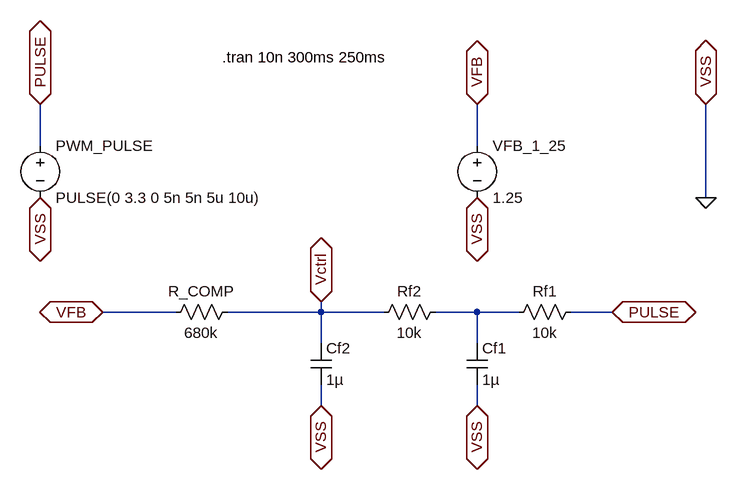
[diagram p0: schematic PWM_FILTER.asc]
PWM_FILTER.asc, the LTspice schematic file:
Version 4.1
SHEET 1 2168 680
WIRE -368 -256 -368 -320
WIRE 304 -256 304 -320
WIRE 656 -176 656 -320
WIRE -160 0 -272 0
WIRE 64 0 64 -16
WIRE 64 0 -80 0
WIRE 160 0 64 0
WIRE 304 0 240 0
WIRE 368 0 304 0
WIRE 512 0 448 0
WIRE 64 48 64 0
WIRE 304 48 304 0
WIRE 64 144 64 112
WIRE 304 144 304 112
FLAG 656 -176 0
FLAG 304 -176 VSS
IOPIN 304 -176 BiDir
FLAG 656 -320 VSS
IOPIN 656 -320 BiDir
FLAG -368 -176 VSS
IOPIN -368 -176 BiDir
FLAG 304 -320 VFB
IOPIN 304 -320 BiDir
FLAG -368 -320 PULSE
IOPIN -368 -320 BiDir
FLAG 64 144 VSS
IOPIN 64 144 BiDir
FLAG 304 144 VSS
IOPIN 304 144 BiDir
FLAG -272 0 VFB
IOPIN -272 0 BiDir
FLAG 512 0 PULSE
IOPIN 512 0 BiDir
FLAG 64 -16 Vctrl
IOPIN 64 -16 BiDir
SYMBOL voltage -368 -272 R0
WINDOW 123 0 0 Left 0
WINDOW 39 0 0 Left 0
SYMATTR InstName PWM_PULSE
SYMATTR Value PULSE(0 3.3 0 5n 5n 5u 10u)
SYMBOL res 464 -16 R90
WINDOW 0 0 56 VBottom 2
WINDOW 3 32 56 VTop 2
SYMATTR InstName Rf1
SYMATTR Value 10k
SYMBOL res 256 -16 R90
WINDOW 0 0 56 VBottom 2
WINDOW 3 32 56 VTop 2
SYMATTR InstName Rf2
SYMATTR Value 10k
SYMBOL cap 288 48 R0
SYMATTR InstName Cf1
SYMATTR Value 1µ
SYMBOL cap 48 48 R0
SYMATTR InstName Cf2
SYMATTR Value 1µ
SYMBOL voltage 304 -272 R0
SYMATTR InstName VFB_1_25
SYMATTR Value 1.25
SYMBOL res -64 -16 R90
WINDOW 0 0 56 VBottom 2
WINDOW 3 32 56 VTop 2
SYMATTR InstName R_COMP
SYMATTR Value 680k
TEXT -88 -392 Left 2 !.tran 10n 300ms 250ms

The netlist it stands for:
* PWM_FILTER.asc
V§PWM_PULSE PULSE 0 PULSE(0 3.3 0 5n 5n 5u 10u)
Rf1 PULSE N001 10k
Rf2 N001 Vctrl 10k
Cf1 N001 0 1µ
Cf2 Vctrl 0 1µ
VFB_1_25 VFB 0 1.25
R_COMP Vctrl VFB 680k
.tran 10n 300ms 250ms
.backanno
.end